# Altium schematic sheet Controller_Section.SchDoc: =Projectname
size A4; DocumentNumber: 3; SheetNumber: 3; SheetTotal: 8
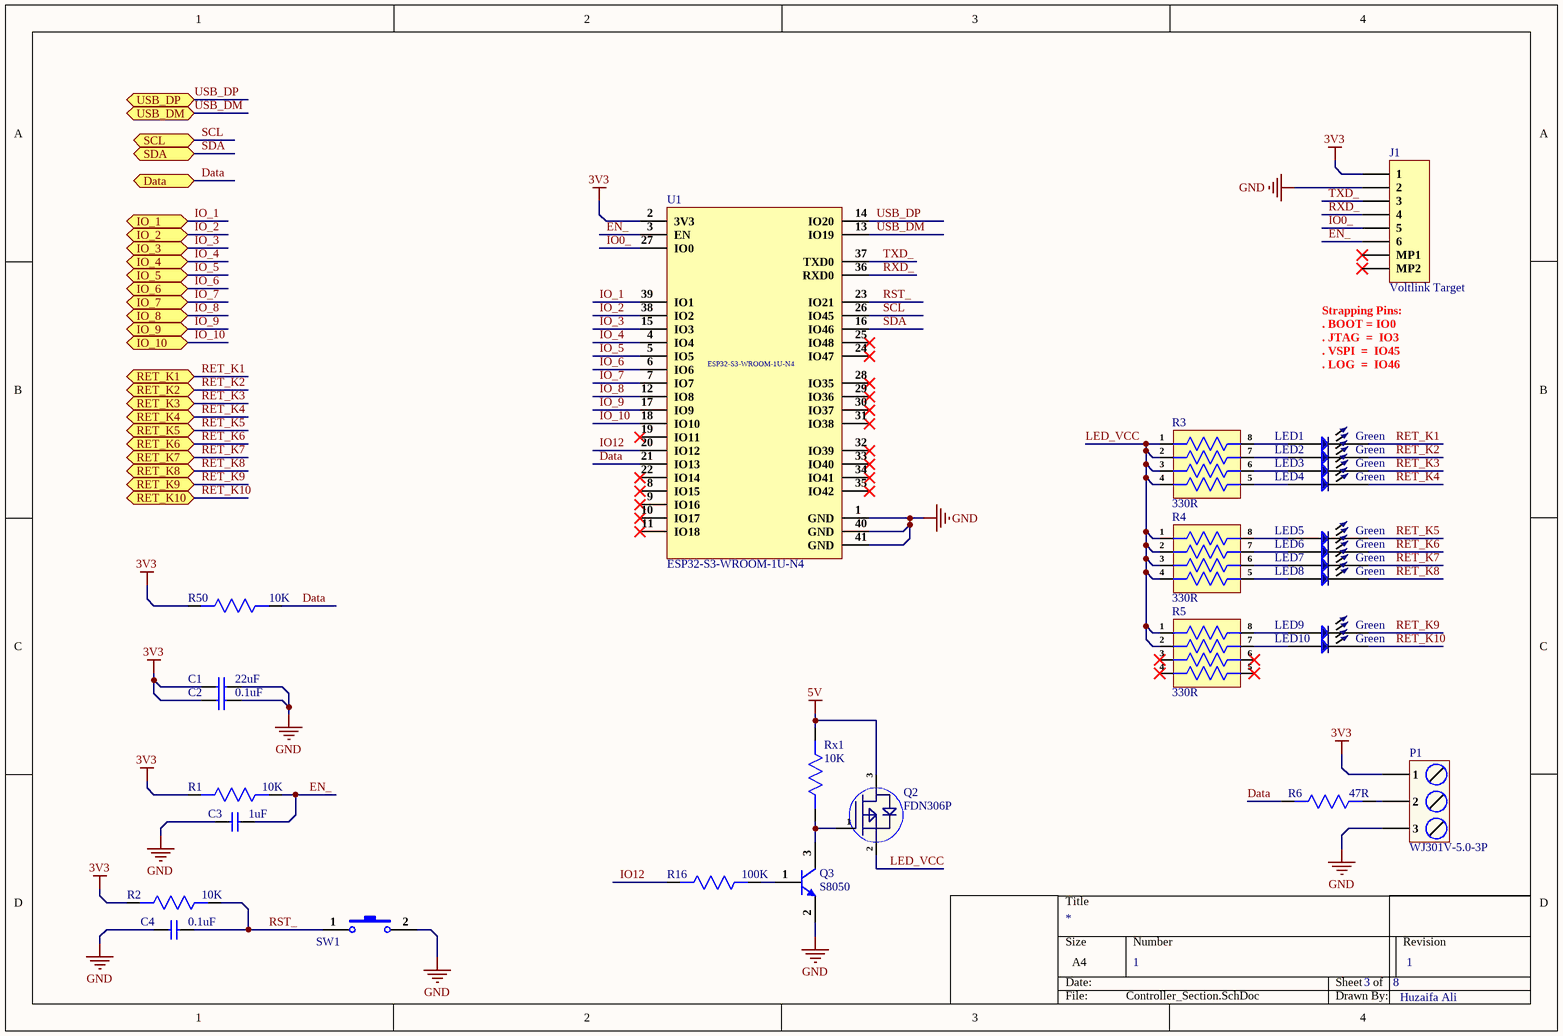
[diagram p0: Controller_Section.SchDoc]

## Parts
C1  22uF  [Cap-0805]
C2  0.1uF  [Cap-0402]
C3  1uF  [Cap-0603]
C4  0.1uF  [Cap-0402]
J1  Voltlink Target  [Voltlink Target]
LED1  Green  [LED-0402]
LED2  Green  [LED-0402]
LED3  Green  [LED-0402]
LED4  Green  [LED-0402]
LED5  Green  [LED-0402]
LED6  Green  [LED-0402]
LED7  Green  [LED-0402]
LED8  Green  [LED-0402]
LED9  Green  [LED-0402]
LED10  Green  [LED-0402]
P1  WJ301V-5.0-3P  [WJ301V-5.0-3P]
Q2  FDN306P  [SOT-23]
Q3  S8050  [SOT-23]
R1  10K  [RES-0603]
R2  10K  [RES-0603]
R3  330R  [Res-0402x4]
R4  330R  [Res-0402x4]
R5  330R  [Res-0402x4]
R6  47R  [Res-0402]
R16  100K  [Res-0402]
R50  10K  [Res-0603]
Rx1  10K  [RES-0603]
SW1  YTS-B003-2A  [YTS-B003-2A]  (value not drawn)
U1  ESP32-S3-WROOM-1U-N4  [41-SMD UFL Module]

## Ports
Data (bidir), IO_1 (bidir), IO_2 (bidir), IO_3 (bidir), IO_4 (bidir), IO_5 (bidir), IO_6 (bidir), IO_7 (bidir), IO_8 (bidir), IO_9 (bidir), IO_10 (bidir), RET_K1 (bidir), RET_K2 (bidir), RET_K3 (bidir), RET_K4 (bidir), RET_K5 (bidir), RET_K6 (bidir), RET_K7 (bidir), RET_K8 (bidir), RET_K9 (bidir), RET_K10 (bidir), SCL (bidir), SDA (bidir), USB_DM (bidir), USB_DP (bidir)

## Nets
3V3: C1.1 C2.1 J1.1 P1.1 R1.2 R2.2 R50.2 U1.2(3V3)
5V: Q2.3(D) Rx1.1
GND: C1.2 C2.2 C3.1 C4.1 J1.2 P1.3 Q3.2(E) SW1.2 U1.1(GND) U1.40(GND) U1.41(GND)
Data: R6.2 R50.1 U1.21(IO13) ; port Data
EN_: C3.2 J1.6 R1.1 U1.3(EN)
IO0_: J1.5 U1.27(IO0)
IO12: R16.2 U1.20(IO12)
IO_1: U1.39(IO1) ; port IO_1
IO_2: U1.38(IO2) ; port IO_2
IO_3: U1.15(IO3) ; port IO_3
IO_4: U1.4(IO4) ; port IO_4
IO_5: U1.5(IO5) ; port IO_5
IO_6: U1.6(IO6) ; port IO_6
IO_7: U1.7(IO7) ; port IO_7
IO_8: U1.12(IO8) ; port IO_8
IO_9: U1.17(IO9) ; port IO_9
IO_10: U1.18(IO10) ; port IO_10
LED_VCC: Q2.2(S) R3.1 R3.2 R3.3 R3.4 R4.1 R4.2 R4.3 R4.4 R5.1 R5.2
RET_K1: LED1.2 ; port RET_K1
RET_K2: LED2.2 ; port RET_K2
RET_K3: LED3.2 ; port RET_K3
RET_K4: LED4.2 ; port RET_K4
RET_K5: LED5.2 ; port RET_K5
RET_K6: LED6.2 ; port RET_K6
RET_K7: LED7.2 ; port RET_K7
RET_K8: LED8.2 ; port RET_K8
RET_K9: LED9.2 ; port RET_K9
RET_K10: LED10.2 ; port RET_K10
RST_: C4.2 R2.1 SW1.1 U1.23(IO21)
RXD_: J1.4 U1.36(RXD0)
SCL: U1.26(IO45) ; port SCL
SDA: U1.16(IO46) ; port SDA
TXD_: J1.3 U1.37(TXD0)
USB_DM: U1.13(IO19) ; port USB_DM
USB_DP: U1.14(IO20) ; port USB_DP
NetLED1_1: LED1.1 R3.8
NetLED2_1: LED2.1 R3.7
NetLED3_1: LED3.1 R3.6
NetLED4_1: LED4.1 R3.5
NetLED5_1: LED5.1 R4.8
NetLED6_1: LED6.1 R4.7
NetLED7_1: LED7.1 R4.6
NetLED8_1: LED8.1 R4.5
NetLED9_1: LED9.1 R5.8
NetLED10_1: LED10.1 R5.7
NetP1_2: P1.2 R6.1
NetQ2_1: Q2.1(G) Q3.3(C) Rx1.2
NetQ3_1: Q3.1(B) R16.1

Not connected (* = marked no-connect by the designer): J1 MP1* MP2*; R5 3* 4* 5* 6*; U1 8(IO15)* 9(IO16)* 10(IO17)* 11(IO18)* 19(IO11)* 22(IO14)* 24(IO47)* 25(IO48)* 28(IO35)* 29(IO36)* 30(IO37)* 31(IO38)* 32(IO39)* 33(IO40)* 34(IO41)* 35(IO42)*

## Notes on the sheet
- (near J1) Strapping Pins:
  . BOOT = IO0
  . JTAG  =  IO3
  . VSPI  =  IO45
  . LOG  =  IO46
- 1
- Huzaifa Ali

## Library data of the parts
C1 = CL21A226MAYNNNE: CAP CER 22UF 25V X5R 0805; Manufacturer: Samsung; Supplier 1: Mouser; Manufacturer Part Number: CL21A226MAYNNNE; RoHS: Yes; Category: Ceramic Capacitors; Stock 1: 1240410; Pricing 1: 1=0.28000, 10=0.18500, 50=0.18500, 100=0.10600, 500=0.07500, 1000=0.06400, 2000=0.06100, 10000=0.05400, 24000=0.05100, 50000=0.04600 (USD); RoHS Compliant: Yes; Supplier Part Number 1: 187-CL21A226MAYNNNE; LCSC Part Number: C602037
C2 C4 = C1005X5R1H104K050BB: CAP CER 0.1UF 50V X5R 0402; Manufacturer: TDK; Dielectric Material: Ceramic; Capacitance: 100nF; Tolerance: 10%; Supplier 1: Digi-Key; Manufacturer Part Number: C1005X5R1H104K050BB; Stock 1: 1455182; Pricing 1: 1=0.12, 10=0.09, 50=0.049, 100=0.04, 500=0.02858, 1000=0.02245, 2500=0.02041, 5000=0.01878 (USD); Mount: Surface Mount; Case/Package: 0402; Case Code (Metric): 1005; Case Code (Imperial): 0402; Weight: 2.3E-05oz; Min Operating Temperature: -55°C; Max Operating Temperature: 85°C; Dielectric: X5R; Voltage Rating: 50V; Packaging: Tape and Reel; Voltage Rating (DC): 50V; Termination: SMD/SMT; Construction: Flat; Package Quantity: 1; Resistor Type: Ceramic; Voltage: 50V; Series: C; Length: 1mm; Width: 0.02inch; Height: 0.5mm; Depth: 0.5mm; Thickness: 0.022inch; Radiation Hardening: No; Lead Free: Lead Free; REACH SVHC: No SVHC; RoHS Compliant: Yes; ComponentLink1URL: https://product.tdk.com/info/en/catalog/spec/mlccspec_commercial_general_midvoltage_en.pdf?src-supplier=Digi-Key; ComponentLink1Description: https://product.tdk.com/info/en/catalog/spec/mlccspec_commercial_general_midvoltage_en.pdf?src-supplier=Digi-Key; ComponentLink2URL: http://www.tdk.co.jp/tefe02/e413_c.pdf?src-supplier=Future+Electronics; ComponentLink2Description: http://www.tdk.co.jp/tefe02/e413_c.pdf?src-supplier=Future+Electronics; ComponentLink3URL: https://www.verical.com/server-webapp/html/getDatasheet?partID=743571&src-supplier=Verical; ComponentLink3Description: https://www.verical.com/server-webapp/html/getDatasheet?partID=743571&src-supplier=Verical; ComponentLink4URL: http://www.tdk.co.jp/tefe02/e412_c.pdf?src-supplier=Avnet+Europe; ComponentLink4Description: http://www.tdk.co.jp/tefe02/e412_c.pdf?src-supplier=Avnet+Europe; Supplier Part Number 1: 445-5942-1-ND; LCSC Part Number: C2181865
C3 = CC0603KRX5R8BB105: CAP CER 1UF 25V X5R 0603; Manufacturer: Yageo; Tolerance: 10%; Supplier 1: Digi-Key; Manufacturer Part Number: CC0603KRX5R8BB105; RoHS: Yes; Category: Ceramic Capacitors; Stock 1: 919939; Pricing 1: 1=0.12000, 10=0.08400, 50=0.04760, 100=0.03940, 500=0.02764, 1000=0.02288 (USD); Mount: Surface Mount; Case/Package: 0603; Number of Pins: 2; Case Code (Metric): 1608; Case Code (Imperial): 0603; Min Operating Temperature: -55°C; Max Operating Temperature: 85°C; Capacitance: 1uF; Dielectric: X5R; Package Quantity: 1; Voltage Rating: 25V; Packaging: Tape and Reel; Termination: SMD/SMT; Voltage Rating (DC): 25V; Series: CC; Construction: Flat; Length: 1.6mm; Width: 0.031inch; Height: 0.8mm; Thickness: 0.035inch; Depth: 0.8mm; Radiation Hardening: No; REACH SVHC: No SVHC; Lead Free: Lead Free; Halogen Free: Halogen Free; RoHS Compliant: Yes; ComponentLink1URL: https://datasheet.ciiva.com/176/mlccorderingcode-176785.pdf?src-supplier=Digi-Key; ComponentLink1Description: https://datasheet.ciiva.com/176/mlccorderingcode-176785.pdf?src-supplier=Digi-Key; ComponentLink2URL: https://datasheet.ciiva.com/176/mlccorderingcode-176786.pdf?src-supplier=Digi-Key; ComponentLink2Description: https://datasheet.ciiva.com/176/mlccorderingcode-176786.pdf?src-supplier=Digi-Key; ComponentLink3URL: https://datasheet.ciiva.com/176/mlccorderingcode-176787.pdf?src-supplier=Digi-Key; ComponentLink3Description: https://datasheet.ciiva.com/176/mlccorderingcode-176787.pdf?src-supplier=Digi-Key; ComponentLink4URL: https://datasheet.ciiva.com/17436/upy-gphc-x5r-4v-to-50v-12-17436952.pdf?src-supplier=Avnet+Europe; ComponentLink4Description: https://datasheet.ciiva.com/17436/upy-gphc-x5r-4v-to-50v-12-17436952.pdf?src-supplier=Avnet+Europe; ComponentLink5URL: https://datasheet.ciiva.com/7978/1525783-7978171.pdf?src-supplier=Element14; ComponentLink5Description: https://datasheet.ciiva.com/7978/1525783-7978171.pdf?src-supplier=Element14; ComponentLink6URL: https://datasheet.ciiva.com/11586/upy-gphc-x5r-4v-to-50v-12-11586318.pdf?src-supplier=Avnet; ComponentLink6Description: https://datasheet.ciiva.com/11586/upy-gphc-x5r-4v-to-50v-12-11586318.pdf?src-supplier=Avnet; Supplier Part Number 1: 311-1445-1-ND; LCSC Part Number: C14664
J1 = Voltlink Target: DNP
LED1-LED10 = 16-213/GHC-YR1S1/3T: Green 520~535nm 0402 Light Emitting Diodes (LED) RoHS; Manufacturer: Everlight Elec; Luminous Intensity (IF=20mA): 112~285mcd; Package: 0402; Illumination Color: Green; Dominant Wavelength / Coordinate rank: 520~535nm; Mounting Type: Surface Mount; Manufacturer Part Number: 16-213/GHC-YR1S1/3T; ComponentLink1Description: LCSC; ComponentLink1URL: https://www.lcsc.com/product-detail/Light-Emitting-Diodes-LED_Everlight-Elec-16-213-GHC-YR1S1-3T_C74338.html; LCSC Part Number: C74338; Item Type: LED
P1 = WJ301V-5.0-3P: P=5.0mm Screw terminal RoHS; Manufacturer: Ningbo Kangnex Elec; Item Type: Terminal Block; Manufacturer Part Number: WJ301V-5.0-3P; Package: Custom; LCSC Part Number: C8483; ComponentLink1Description: LCSC; ComponentLink1URL: https://www.lcsc.com/product-detail/Screw-terminal_Ningbo-Kangnex-Elec-WJ301V-5-0-3P_C8483.html
Q2 = FDN306P: MOSFET P-CH 12V 2.6A SUPERSOT3; Manufacturer: ON Semiconductor / Fairchild; Rds On Max: 40mR; Input Capacitance: 1.138nF; Max Power Dissipation: 500mW; Gate to Source Voltage (Vgs): 8V; Number of Elements: 1; Turn-Off Delay Time: 38ns; Turn-On Delay Time: 11ns; Element Configuration: Single; Rise Time: 10ns; Threshold Voltage: -600mV; Drain to Source Breakdown Voltage: -12V; Polarity: P-CHANNEL; Current Rating: -2.6A; Current: 26A; Supplier 1: Digi-Key; Manufacturer Part Number: FDN306P; RoHS: Yes; Category: MOSFETs; Stock 1: 12409; Pricing 1: 1=0.59000, 10=0.50700, 25=0.47360, 100=0.37880, 500=0.29766, 1000=0.23001 (USD); Mount: Surface Mount; Case/Package: TO-236-3; Number of Pins: 3; Contact Plating: Tin,Matte; Min Operating Temperature: -55°C; Max Operating Temperature: 150°C; Packaging: Tape and Reel; Package Quantity: 3000; Drain to Source Voltage (Vdss): 12V; Continuous Drain Current (ID): 2.6A; Drain to Source Resistance: 40mR; Power Dissipation: 500mW; Series: PowerTrench®; Fall Time: 10ns; Nominal Vgs: -600mV; On-State Resistance: 40MR; Drain-source On Resistance-Max: 40MR; Dual Supply Voltage: -12V; Termination: SMD/SMT; Voltage Rating (DC): -12V; Voltage: 12V; Length: 2.92mm; Width: 1.4mm; Height: 0.94mm; Radiation Hardening: No; REACH SVHC: No SVHC; RoHS Compliant: Yes; Lead Free: Lead Free; ComponentLink1URL: https://datasheet.ciiva.com/6383/fdn306p-6383301.pdf?src-supplier=Digi-Key; ComponentLink1Description: https://datasheet.ciiva.com/6383/fdn306p-6383301.pdf?src-supplier=Digi-Key; ComponentLink2URL: https://datasheet.ciiva.com/4439/fdn306p-50876-4439911.pdf?src-supplier=Mouser; ComponentLink2Description: https://datasheet.ciiva.com/4439/fdn306p-50876-4439911.pdf?src-supplier=Mouser; ComponentLink3URL: https://datasheet.ciiva.com/27050/889760-27050636.pdf?src-supplier=Jameco; ComponentLink3Description: https://datasheet.ciiva.com/27050/889760-27050636.pdf?src-supplier=Jameco; ComponentLink4URL: https://datasheet.ciiva.com/14170/fdn306p-eng-tds-14170925.pdf?src-supplier=Distrelec; ComponentLink4Description: https://datasheet.ciiva.com/14170/fdn306p-eng-tds-14170925.pdf?src-supplier=Distrelec; ComponentLink5URL: https://datasheet.ciiva.com/22700/264983-22700885.pdf?src-supplier=Element14; ComponentLink5Description: https://datasheet.ciiva.com/22700/264983-22700885.pdf?src-supplier=Element14; ComponentLink6URL: https://datasheet.ciiva.com/26144/fdn306p-26144214.pdf?src-supplier=Avnet+Europe; ComponentLink6Description: https://datasheet.ciiva.com/26144/fdn306p-26144214.pdf?src-supplier=Avnet+Europe; ComponentLink7URL: https://datasheet.ciiva.com/6383/fdn306p-6383304.pdf?src-supplier=Digi-Key; ComponentLink7Description: https://datasheet.ciiva.com/6383/fdn306p-6383304.pdf?src-supplier=Digi-Key; ComponentLink8URL: https://datasheet.ciiva.com/11175/fdn306p-11175160.pdf?src-supplier=Avnet; ComponentLink8Description: https://datasheet.ciiva.com/11175/fdn306p-11175160.pdf?src-supplier=Avnet; ComponentLink9URL: https://datasheet.ciiva.com/6383/fdn306p-6383306.pdf?src-supplier=Digi-Key; ComponentLink9Description: https://datasheet.ciiva.com/6383/fdn306p-6383306.pdf?src-supplier=Digi-Key; ComponentLink10URL: https://datasheet.ciiva.com/17275/fdn306p-17275114.pdf?src-supplier=Future+Electronics; ComponentLink10Description: https://datasheet.ciiva.com/17275/fdn306p-17275114.pdf?src-supplier=Future+Electronics; ComponentLink11URL: https://datasheet.ciiva.com/22655/fdn306p-22655327.pdf?src-supplier=Element14; ComponentLink11Description: https://datasheet.ciiva.com/22655/fdn306p-22655327.pdf?src-supplier=Element14; Supplier Part Number 1: FDN306PCT-ND; LCSC Part Number: C725031
Q3 = S8050: Trans Gp Bjt NPN 25V 1.5A 300MW 3-PIN SOT-23 T/r; Manufacturer: Comchip; Manufacturer Part Number: SS8050-G; Collector Emitter Voltage (VCEO): 400mV; Transition Frequency: 100MHz; Supplier 1: Arrow Electronics; RoHS: Yes; Stock 1: 2514; Pricing 1: 1=0.26480, 10=0.19960, 25=0.19760, 50=0.19590, 100=0.09990, 250=0.09890, 500=0.07670, 1000=0.05180 (USD); Mount: Surface Mount; Case/Package: TO-236-3; Packaging: Tape and Reel; Max Power Dissipation: 300mW; Max Collector Current: 1.5A; Collector Emitter Breakdown Voltage: 25V; Max Breakdown Voltage: 25V; ComponentLink1URL: http://www.comchiptech.com/admin/files/product/SS8050-G RevA181526.pdf?src-supplier=Digi-Key; ComponentLink1Description: http://www.comchiptech.com/admin/files/product/SS8050-G RevA181526.pdf?src-supplier=Digi-Key; ComponentLink2URL: http://www.comchiptech.com/cms/UserFiles/SS8050-G%20RevA181526.pdf?src-supplier=Digi-Key; ComponentLink2Description: http://www.comchiptech.com/cms/UserFiles/SS8050-G%20RevA181526.pdf?src-supplier=Digi-Key; Supplier Part Number 1: SS8050-G; LCSC Part Number: C105433
R1 R2 Rx1 = CRGH0603J10K: RES SMD 10K OHM 5% 1/5W 0603; Manufacturer: TE Connectivity Holsworthy; Resistance: 10kR; Temperature Coefficient: 100ppm/°C; Power Rating: 200mW; Voltage Rating: 50V; Number of Resistors: 1; ComponentLink1URL: http://www.farnell.com/datasheets/2167052.pdf?src-supplier=Element14; ComponentLink1Description: http://www.farnell.com/datasheets/2167052.pdf?src-supplier=Element14; ComponentLink2URL: https://www.rohm.com/datasheet/ESR01MZPF/esr-e?src-supplier=Digi-Key; ComponentLink2Description: https://www.rohm.com/datasheet/ESR01MZPF/esr-e?src-supplier=Digi-Key; Supplier 1: Digi-Key; Manufacturer Part Number: CRGH0603J10K; Stock 1: 85818; Pricing 1: 1=0.1, 10=0.049, 100=0.02, 1000=0.00899, 2500=0.0078 (USD); Mount: Surface Mount; Case/Package: 0603; Case Code (Imperial): 0603; Case Code (Metric): 1608; Min Operating Temperature: -55°C; Max Operating Temperature: 125°C; Tolerance: 5%; Packaging: Tape and Reel; Resistor Type: Thick Film,Power resistor; Number of Terminations: 2; Series: CRGH; Termination: Solder; Voltage Rating (DC): 50V; Resistance Tolerance: 5%; Technology: THICK FILM; Length: 1.6mm; Width: 0.8mm; Height: 0.45mm; Depth: 0.8mm; RoHS Compliant: Yes; REACH SVHC: No SVHC; ELV: Compliant; ComponentLink3URL: http://www.farnell.com/datasheets/2007183.pdf?src-supplier=Element14; ComponentLink3Description: http://www.farnell.com/datasheets/2007183.pdf?src-supplier=Element14; Supplier Part Number 1: A126394DKR-ND; LCSC Part Number: C2092011
R3-R5 = CN24JTN331: 4 8 ±5% 330Ω 62.5mW ±250ppm/℃ 0402x4 Resistor Networks & Arrays ROHS; Manufacturer: TA-I Tech; Item Type: Resistor Array; Manufacturer Part Number: CN24JTN331; Package: 0402x4; LCSC Part Number: C162973; ComponentLink1Description: LCSC; ComponentLink1URL: https://www.lcsc.com/product-detail/span-style-background-color-ff0-Resistor-span-Networks-Arrays_TA-I-Tech-CN24JTN331_C162973.html
R6 = ERJ-2RKF47R0X: RES SMD 47 OHM 1% 1/10W 0402; Manufacturer: Panasonic; Temperature Coefficient: 100ppm/°C; Power Rating: 100mW; Voltage Rating: 50V; Item Type: Resistor; Supplier 1: Avnet; Manufacturer Part Number: ERJ-2RKF47R0X; RoHS: Yes; Category: Chip SMD Resistors; Stock 1: 48669; Pricing 1: 1=0.08100, 25=0.03700, 100=0.01500, 250=0.01300, 500=0.01000, 1000=0.00700, 2500=0.00500 (USD); Mount: Surface Mount; Case/Package: 0402; Number of Pins: 2; Contact Plating: Tin; Case Code (Metric): 1005; Case Code (Imperial): 0402; Weight: 2.8E-05oz; Min Operating Temperature: -55°C; Max Operating Temperature: 155°C; Resistance: 47R; Tolerance: 1%; Resistor Type: Thick Film; Packaging: Tape and Reel; Package Quantity: 1; Number of Terminations: 2; Termination: SMD/SMT; Max Power Dissipation: 100mW; Voltage Rating (DC): 50V; Features: Automotive AEC-Q200; Series: ERJ; Resistance Tolerance: 1%; Construction: Rectangular; Technology: THICK FILM; Length: 1mm; Width: 0.5mm; Height: 0.35mm; Depth: 0.5mm; Reach SVHC Compliant: Yes; Military Standard: Not; Lead Free: Lead Free; RoHS Compliant: Yes; ComponentLink1URL: https://datasheet.ciiva.com/11821/0900766b80f80784-11821333.pdf?src-supplier=RSComponents; ComponentLink1Description: https://datasheet.ciiva.com/11821/0900766b80f80784-11821333.pdf?src-supplier=RSComponents; ComponentLink2URL: https://datasheet.ciiva.com/6082/aoa0000ce2-6082054.pdf?src-supplier=Farnell; ComponentLink2Description: https://datasheet.ciiva.com/6082/aoa0000ce2-6082054.pdf?src-supplier=Farnell; ComponentLink3URL: https://datasheet.ciiva.com/7886/aoa0000ce2-7886719.pdf?src-supplier=Element14; ComponentLink3Description: https://datasheet.ciiva.com/7886/aoa0000ce2-7886719.pdf?src-supplier=Element14; ComponentLink4URL: https://datasheet.ciiva.com/7887/426256-7887019.pdf?src-supplier=Element14; ComponentLink4Description: https://datasheet.ciiva.com/7887/426256-7887019.pdf?src-supplier=Element14; ComponentLink5URL: https://datasheet.ciiva.com/43467/1678782-43467189.pdf?src-supplier=Farnell; ComponentLink5Description: https://datasheet.ciiva.com/43467/1678782-43467189.pdf?src-supplier=Farnell; ComponentLink6URL: https://datasheet.ciiva.com/46373/1678782-46373909.pdf?src-supplier=Element14; ComponentLink6Description: https://datasheet.ciiva.com/46373/1678782-46373909.pdf?src-supplier=Element14; ComponentLink7URL: https://datasheet.ciiva.com/22684/1678782-22684775.pdf?src-supplier=Element14; ComponentLink7Description: https://datasheet.ciiva.com/22684/1678782-22684775.pdf?src-supplier=Element14; ComponentLink8URL: https://datasheet.ciiva.com/46373/1678782-46373910.pdf?src-supplier=Element14; ComponentLink8Description: https://datasheet.ciiva.com/46373/1678782-46373910.pdf?src-supplier=Element14; ComponentLink9URL: https://datasheet.ciiva.com/24165/aoa0000ce2-24165246.pdf?src-supplier=Mouser; ComponentLink9Description: https://datasheet.ciiva.com/24165/aoa0000ce2-24165246.pdf?src-supplier=Mouser; ComponentLink10URL: https://datasheet.ciiva.com/16786/70260748-16786359.pdf?src-supplier=Allied+Electronics; ComponentLink10Description: https://datasheet.ciiva.com/16786/70260748-16786359.pdf?src-supplier=Allied+Electronics; ComponentLink11URL: https://datasheet.ciiva.com/16783/70260748-16783259.pdf?src-supplier=Allied+Electronics; ComponentLink11Description: https://datasheet.ciiva.com/16783/70260748-16783259.pdf?src-supplier=Allied+Electronics; ComponentLink12URL: https://datasheet.ciiva.com/9189/aoa0000ce2-9189325.pdf?src-supplier=Avnet; ComponentLink12Description: https://datasheet.ciiva.com/9189/aoa0000ce2-9189325.pdf?src-supplier=Avnet; ComponentLink13URL: https://datasheet.ciiva.com/9189/aoa0000ce2-9189323.pdf?src-supplier=Avnet; ComponentLink13Description: https://datasheet.ciiva.com/9189/aoa0000ce2-9189323.pdf?src-supplier=Avnet; Supplier Part Number 1: 64R5286; LCSC Part Number: C413056
R16 = RC0402FR-07100KL: RES 100K OHM 1% 1/16W 0402; Manufacturer: Yageo; Resistance: 100kR; Temperature Coefficient: 100ppm/°C; Power Rating: 63mW; Voltage Rating: 50V; Supplier 1: Mouser; Manufacturer Part Number: RC0402FR-07100KL; RoHS: Yes; Category: Chip SMD Resistors; Stock 1: 7759549; Pricing 1: 1=0.10000, 10=0.01200, 50=0.01200, 100=0.00500, 1000=0.00300, 2500=0.00200, 10000=0.00100 (USD); Case/Package: 0402; Case Code (Metric): 1005; Case Code (Imperial): 0402; Min Operating Temperature: -55°C; Max Operating Temperature: 155°C; Resistor Type: Thick Film; Tolerance: 1%; Packaging: Tape and Reel; Package Quantity: 1; Number of Terminations: 2; Termination: SMD/SMT; Max Power Dissipation: 63mW; Working Voltage: 50V; Features: Moisture Resistant; Series: RC; Resistance Tolerance: 1%; Construction: Rectangular; Technology: THICK FILM; Length: 0.039inch; Width: 0.02inch; Height: 0.016inch; Depth: 0.5mm; REACH SVHC: No SVHC; Lead Free: Lead Free; RoHS Compliant: Yes; Military Standard: Not; ComponentLink1URL: https://datasheet.ciiva.com/11819/0900766b80c66297-11819452.pdf?src-supplier=RSComponents; ComponentLink1Description: https://datasheet.ciiva.com/11819/0900766b80c66297-11819452.pdf?src-supplier=RSComponents; ComponentLink2URL: https://datasheet.ciiva.com/22747/1018594-22747509.pdf?src-supplier=Element14; ComponentLink2Description: https://datasheet.ciiva.com/22747/1018594-22747509.pdf?src-supplier=Element14; ComponentLink3URL: https://datasheet.ciiva.com/2453/pyu-r-int-thick-7-2453362.pdf?src-supplier=Digi-Key; ComponentLink3Description: https://datasheet.ciiva.com/2453/pyu-r-int-thick-7-2453362.pdf?src-supplier=Digi-Key; ComponentLink4URL: https://datasheet.ciiva.com/2453/pyu-r-int-thick-7-2453363.pdf?src-supplier=Digi-Key; ComponentLink4Description: https://datasheet.ciiva.com/2453/pyu-r-int-thick-7-2453363.pdf?src-supplier=Digi-Key; ComponentLink5URL: https://datasheet.ciiva.com/2453/pyu-r-int-thick-7-2453361.pdf?src-supplier=Digi-Key; ComponentLink5Description: https://datasheet.ciiva.com/2453/pyu-r-int-thick-7-2453361.pdf?src-supplier=Digi-Key; ComponentLink6URL: https://datasheet.ciiva.com/12667/pyu-rc0402-51-rohs-l-6-r-12667930.pdf?src-supplier=Mouser; ComponentLink6Description: https://datasheet.ciiva.com/12667/pyu-rc0402-51-rohs-l-6-r-12667930.pdf?src-supplier=Mouser; ComponentLink7URL: https://datasheet.ciiva.com/15189/getdatasheetpartid-323696-15189334.pdf?src-supplier=Verical; ComponentLink7Description: https://datasheet.ciiva.com/15189/getdatasheetpartid-323696-15189334.pdf?src-supplier=Verical; Supplier Part Number 1: 603-RC0402FR-07100KL
R50 = RC0603FR-0710KL: RES SMD 10K Ohm 1% 1/10W 0603; Manufacturer: Yageo; Resistance: 10kR; Temperature Coefficient: 100ppm/°C; Voltage Rating (DC): 50V; Power Rating: 100mW; Voltage Rating: 75V; Supplier 1: Digi-Key; Manufacturer Part Number: RC0603FR-0710KL; RoHS: Yes; Category: Chip SMD Resistors; Stock 1: 25249139; Pricing 1: 1=0.10000, 10=0.02400, 100=0.00970, 1000=0.00436, 2500=0.00378 (USD); Case/Package: 0603; Number of Pins: 2; Case Code (Imperial): 0603; Case Code (Metric): 1608; Weight: 7.1E-05oz; Size Code: 0603; Min Operating Temperature: -55°C; Max Operating Temperature: 155°C; Tolerance: 1%; Resistor Type: Thick Film; Packaging: Tape and Reel; Termination: SMD/SMT; Features: Moisture Resistant; Series: RC; Max Power Dissipation: 100mW; Number of Terminations: 2; Resistance Tolerance: 1%; Construction: Rectangular; Length: 1.6mm; Width: 0.8mm; Height: 0.45mm; Depth: 0.8mm; Lead Pitch: 0.3mm; REACH SVHC: Unknown; Lead Free: Lead Free; Military Standard: Not; RoHS Compliant: Yes; ComponentLink1URL: https://datasheet.ciiva.com/7660/38590-7660789.pdf?src-supplier=Element14; ComponentLink1Description: https://datasheet.ciiva.com/7660/38590-7660789.pdf?src-supplier=Element14; ComponentLink2URL: https://datasheet.ciiva.com/7983/443971-7983596.pdf?src-supplier=Element14; ComponentLink2Description: https://datasheet.ciiva.com/7983/443971-7983596.pdf?src-supplier=Element14; ComponentLink3URL: https://datasheet.ciiva.com/22747/443971-22747519.pdf?src-supplier=Element14; ComponentLink3Description: https://datasheet.ciiva.com/22747/443971-22747519.pdf?src-supplier=Element14; ComponentLink4URL: https://datasheet.ciiva.com/46440/1868787-46440891.pdf?src-supplier=Element14; ComponentLink4Description: https://datasheet.ciiva.com/46440/1868787-46440891.pdf?src-supplier=Element14; ComponentLink5URL: https://datasheet.ciiva.com/7746/1738695-7746239.pdf?src-supplier=Element14; ComponentLink5Description: https://datasheet.ciiva.com/7746/1738695-7746239.pdf?src-supplier=Element14; ComponentLink6URL: https://datasheet.ciiva.com/15189/getdatasheetpartid-409289-15189591.pdf?src-supplier=Verical; ComponentLink6Description: https://datasheet.ciiva.com/15189/getdatasheetpartid-409289-15189591.pdf?src-supplier=Verical; Supplier Part Number 1: 311-10.0KHRCT-ND; LCSC Part Number: C98220
SW1 = YTS-B003-2A: 3.5mm 3.5mm SMDSplicing Black Rectangle button 50mA Surface Mount 7mm SPST 100MΩ 20000 12V 250gf@±50gf SMD Tactile Switches ROHS; Manufacturer: YIYUAN; Item Type: Switch; Manufacturer Part Number: YTS-B003-2A; Package: Custom; LCSC Part Number: C2910695; ComponentLink1Description: LCSC; ComponentLink1URL: https://lcsc.com/product-detail/Tactile-Switches_YIYUAN-YTS-B003-2A_C2910695.html
U1 = ESP32-S3-WROOM-1U-N4: RF TXRX MOD WIFI SURFACE MOUNT; Manufacturer: Espressif Systems; Item Type: Module; Supplier 1: Digi-Key; Manufacturer Part Number: ESP32-S3-WROOM-1U-N4; RoHS: No; Category: Uncategorized; Stock 1: 594; Pricing 1: 1=3.25000 (USD); Supplier Part Number 1: 1965-ESP32-S3-WROOM-1U-N4CT-ND; ComponentLink1Description: LCSC; ComponentLink1URL: https://www.lcsc.com/product-detail/WiFi-Modules_Espressif-Systems-ESP32-WROOM-32-N4_C82899.html; LCSC Part Number: C2980296